# Altium schematic sheet 00_BMS_TOP.SchDoc
size A4; SheetNumber: 1; SheetTotal: 4
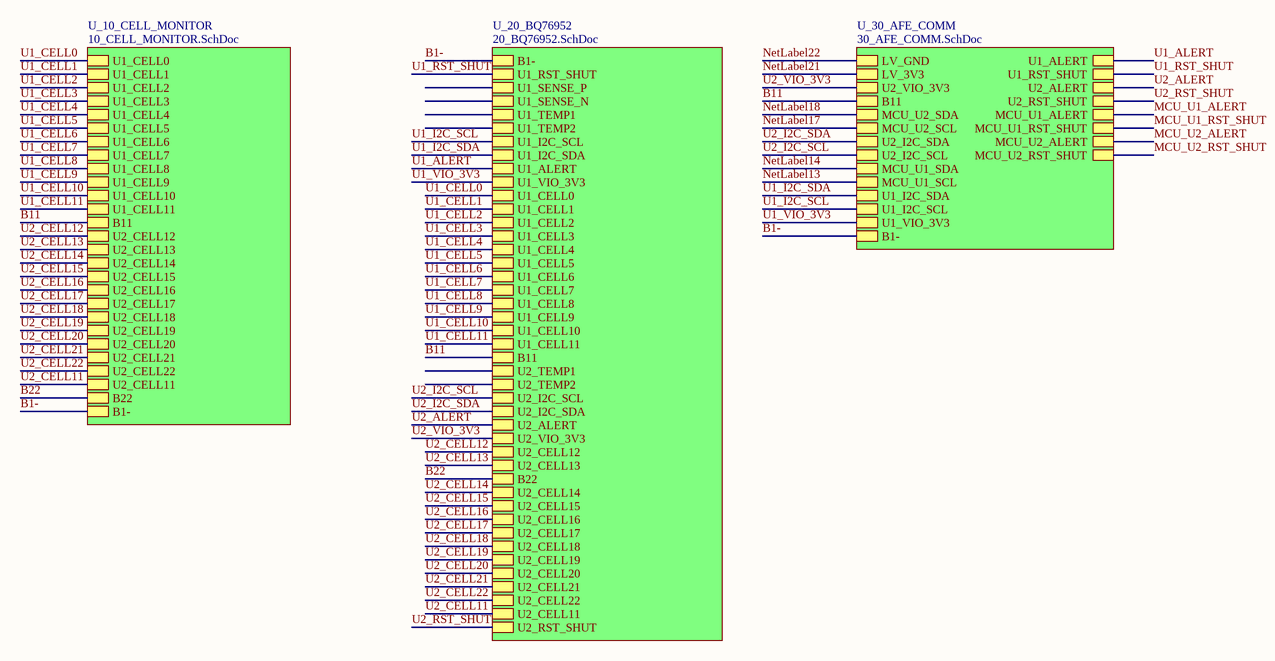
[diagram p0: 00_BMS_TOP.SchDoc]

## Sub-sheets
U_10_CELL_MONITOR = 10_CELL_MONITOR.SchDoc: U1_CELL0, U1_CELL1, U1_CELL2, U1_CELL3, U1_CELL4, U1_CELL5, U1_CELL6, U1_CELL7, U1_CELL8, U1_CELL9, U1_CELL10, U1_CELL11, B11, U2_CELL12, U2_CELL13, U2_CELL14, U2_CELL15, U2_CELL16, U2_CELL17, U2_CELL18, U2_CELL19, U2_CELL20, U2_CELL21, U2_CELL22, U2_CELL11, B22, B1-
U_20_BQ76952 = 20_BQ76952.SchDoc: B1-, U1_SENSE_P, U1_SENSE_N, U1_TEMP1, U1_TEMP2, U1_I2C_SCL, U1_I2C_SDA, U1_ALERT, U1_VIO_3V3, U1_CELL0, U1_CELL1, U1_CELL2, U1_CELL3, U1_CELL4, U1_CELL5, U1_CELL6, U1_CELL7, U1_CELL8, U1_CELL9, U1_CELL10, U1_CELL11, B11, U2_TEMP1, U2_TEMP2, U2_I2C_SCL, U2_I2C_SDA, U2_ALERT, U2_VIO_3V3, U2_CELL12, U2_CELL13, B22, U2_CELL14, U2_CELL15, U2_CELL16, U2_CELL17, U2_CELL18, U2_CELL19, U2_CELL20, U2_CELL21, U2_CELL22, U2_CELL11, U2_RST_SHUT, U1_RST_SHUT
U_30_AFE_COMM = 30_AFE_COMM.SchDoc: LV_GND, LV_3V3, U2_VIO_3V3, B11, MCU_U2_SDA, MCU_U2_SCL, U2_I2C_SDA, U2_I2C_SCL, MCU_U1_SDA, MCU_U1_SCL, U1_I2C_SDA, U1_I2C_SCL, U1_VIO_3V3, B1-, U2_ALERT, MCU_U2_ALERT, MCU_U2_RST_SHUT, U2_RST_SHUT, U1_ALERT, MCU_U1_ALERT, MCU_U1_RST_SHUT, U1_RST_SHUT

## Nets
B1-: sheet U_10_CELL_MONITOR/B1-, sheet U_20_BQ76952/B1-, sheet U_30_AFE_COMM/B1-
B11: sheet U_10_CELL_MONITOR/B11, sheet U_20_BQ76952/B11, sheet U_30_AFE_COMM/B11
B22: sheet U_10_CELL_MONITOR/B22, sheet U_20_BQ76952/B22
MCU_U1_ALERT: sheet U_30_AFE_COMM/MCU_U1_ALERT
MCU_U1_RST_SHUT: sheet U_30_AFE_COMM/MCU_U1_RST_SHUT
MCU_U2_ALERT: sheet U_30_AFE_COMM/MCU_U2_ALERT
MCU_U2_RST_SHUT: sheet U_30_AFE_COMM/MCU_U2_RST_SHUT
NetLabel13: sheet U_30_AFE_COMM/MCU_U1_SCL
NetLabel14: sheet U_30_AFE_COMM/MCU_U1_SDA
NetLabel17: sheet U_30_AFE_COMM/MCU_U2_SCL
NetLabel18: sheet U_30_AFE_COMM/MCU_U2_SDA
NetLabel21: sheet U_30_AFE_COMM/LV_3V3
NetLabel22: sheet U_30_AFE_COMM/LV_GND
U1_ALERT: sheet U_20_BQ76952/U1_ALERT, sheet U_30_AFE_COMM/U1_ALERT
U1_CELL0: sheet U_10_CELL_MONITOR/U1_CELL0, sheet U_20_BQ76952/U1_CELL0
U1_CELL1: sheet U_10_CELL_MONITOR/U1_CELL1, sheet U_20_BQ76952/U1_CELL1
U1_CELL2: sheet U_10_CELL_MONITOR/U1_CELL2, sheet U_20_BQ76952/U1_CELL2
U1_CELL3: sheet U_10_CELL_MONITOR/U1_CELL3, sheet U_20_BQ76952/U1_CELL3
U1_CELL4: sheet U_10_CELL_MONITOR/U1_CELL4, sheet U_20_BQ76952/U1_CELL4
U1_CELL5: sheet U_10_CELL_MONITOR/U1_CELL5, sheet U_20_BQ76952/U1_CELL5
U1_CELL6: sheet U_10_CELL_MONITOR/U1_CELL6, sheet U_20_BQ76952/U1_CELL6
U1_CELL7: sheet U_10_CELL_MONITOR/U1_CELL7, sheet U_20_BQ76952/U1_CELL7
U1_CELL8: sheet U_10_CELL_MONITOR/U1_CELL8, sheet U_20_BQ76952/U1_CELL8
U1_CELL9: sheet U_10_CELL_MONITOR/U1_CELL9, sheet U_20_BQ76952/U1_CELL9
U1_CELL10: sheet U_10_CELL_MONITOR/U1_CELL10, sheet U_20_BQ76952/U1_CELL10
U1_CELL11: sheet U_10_CELL_MONITOR/U1_CELL11, sheet U_20_BQ76952/U1_CELL11
U1_I2C_SCL: sheet U_20_BQ76952/U1_I2C_SCL, sheet U_30_AFE_COMM/U1_I2C_SCL
U1_I2C_SDA: sheet U_20_BQ76952/U1_I2C_SDA, sheet U_30_AFE_COMM/U1_I2C_SDA
U1_RST_SHUT: sheet U_20_BQ76952/U1_RST_SHUT, sheet U_30_AFE_COMM/U1_RST_SHUT
U1_VIO_3V3: sheet U_20_BQ76952/U1_VIO_3V3, sheet U_30_AFE_COMM/U1_VIO_3V3
U2_ALERT: sheet U_20_BQ76952/U2_ALERT, sheet U_30_AFE_COMM/U2_ALERT
U2_CELL11: sheet U_10_CELL_MONITOR/U2_CELL11, sheet U_20_BQ76952/U2_CELL11
U2_CELL12: sheet U_10_CELL_MONITOR/U2_CELL12, sheet U_20_BQ76952/U2_CELL12
U2_CELL13: sheet U_10_CELL_MONITOR/U2_CELL13, sheet U_20_BQ76952/U2_CELL13
U2_CELL14: sheet U_10_CELL_MONITOR/U2_CELL14, sheet U_20_BQ76952/U2_CELL14
U2_CELL15: sheet U_10_CELL_MONITOR/U2_CELL15, sheet U_20_BQ76952/U2_CELL15
U2_CELL16: sheet U_10_CELL_MONITOR/U2_CELL16, sheet U_20_BQ76952/U2_CELL16
U2_CELL17: sheet U_10_CELL_MONITOR/U2_CELL17, sheet U_20_BQ76952/U2_CELL17
U2_CELL18: sheet U_10_CELL_MONITOR/U2_CELL18, sheet U_20_BQ76952/U2_CELL18
U2_CELL19: sheet U_10_CELL_MONITOR/U2_CELL19, sheet U_20_BQ76952/U2_CELL19
U2_CELL20: sheet U_10_CELL_MONITOR/U2_CELL20, sheet U_20_BQ76952/U2_CELL20
U2_CELL21: sheet U_10_CELL_MONITOR/U2_CELL21, sheet U_20_BQ76952/U2_CELL21
U2_CELL22: sheet U_10_CELL_MONITOR/U2_CELL22, sheet U_20_BQ76952/U2_CELL22
U2_I2C_SCL: sheet U_20_BQ76952/U2_I2C_SCL, sheet U_30_AFE_COMM/U2_I2C_SCL
U2_I2C_SDA: sheet U_20_BQ76952/U2_I2C_SDA, sheet U_30_AFE_COMM/U2_I2C_SDA
U2_RST_SHUT: sheet U_20_BQ76952/U2_RST_SHUT, sheet U_30_AFE_COMM/U2_RST_SHUT
U2_VIO_3V3: sheet U_20_BQ76952/U2_VIO_3V3, sheet U_30_AFE_COMM/U2_VIO_3V3